# Altium schematic sheet Power.SchDoc
size A2
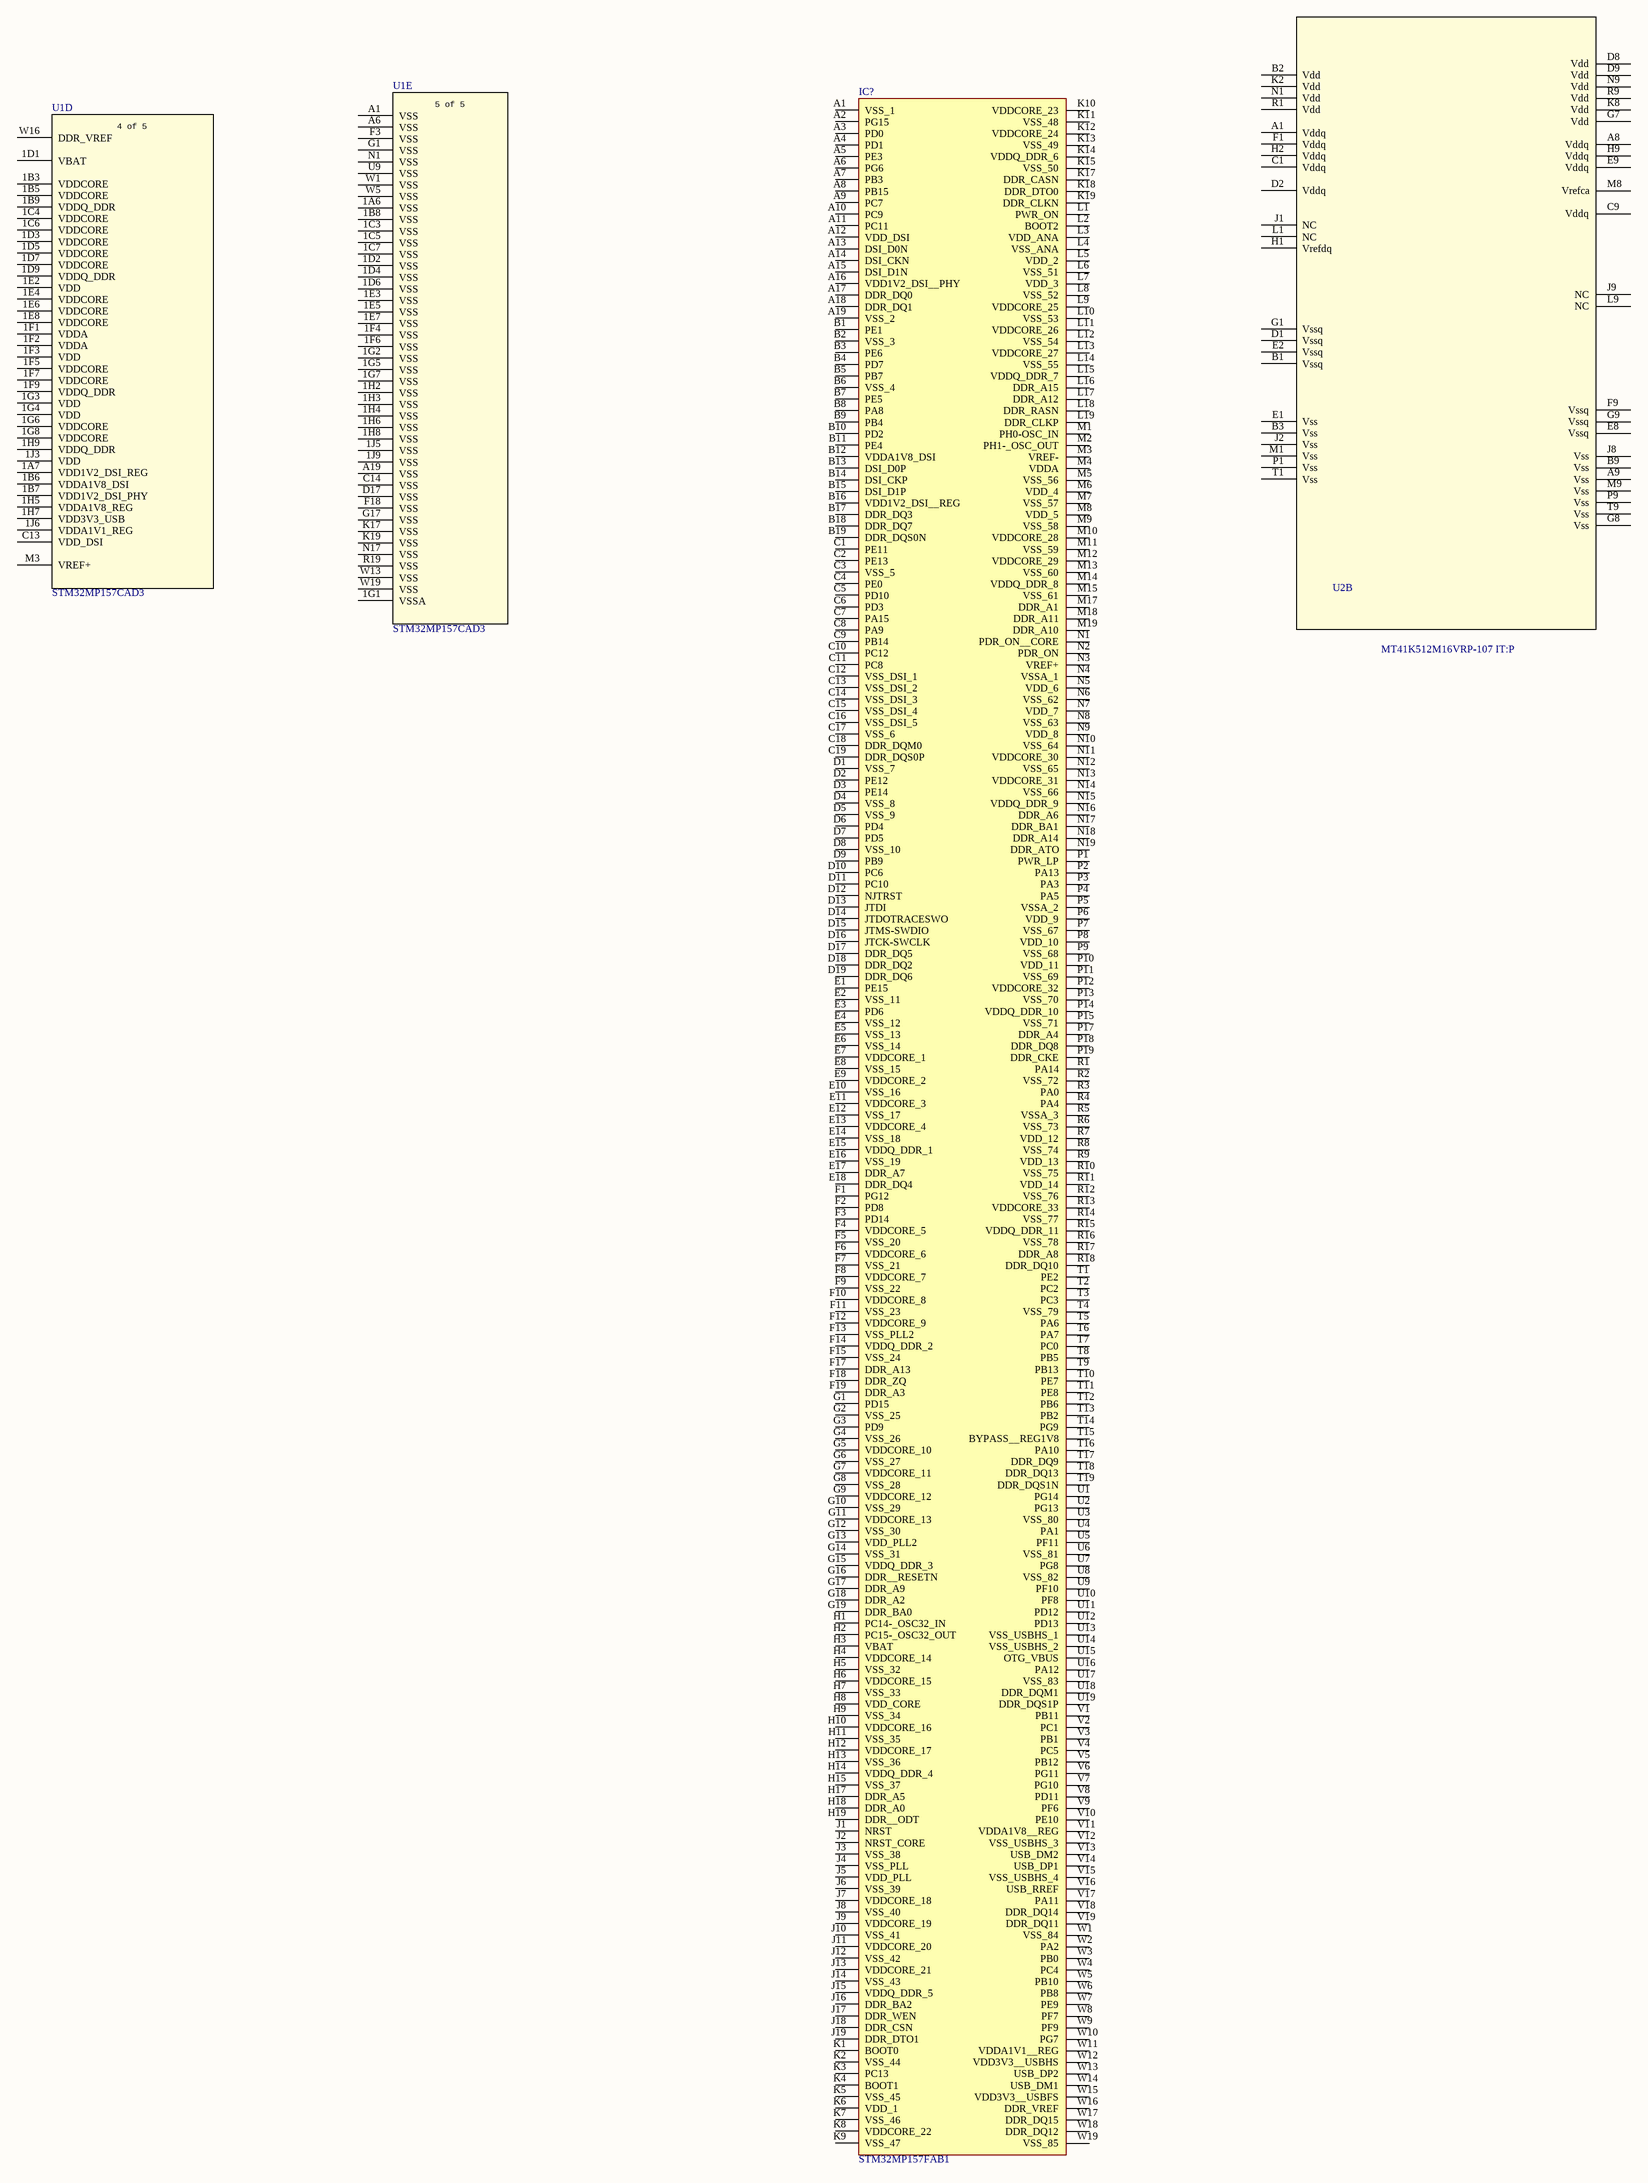
[diagram p0: Power.SchDoc]

## Parts
IC?  STM32MP157FAB1  [BGA354C80P19X19_1600X1600X129]
U1  STM32MP157CAD3  [TFBGA257_10X10]  (parts D,E of 5)
U2  MT41K512M16VRP-107 IT:P  [FBGA96_MRN]  (part B of 2)

## Nets

Not connected (* = marked no-connect by the designer): IC? A1(VSS_1) A2(PG15) A3(PD0) A4(PD1) A5(PE3) A6(PG6) A7(PB3) A8(PB15) A9(PC7) A10(PC9) A11(PC11) A12(VDD_DSI) A13(DSI_D0N) A14(DSI_CKN) A15(DSI_D1N) A16(VDD1V2_DSI__PHY) A17(DDR_DQ0) A18(DDR_DQ1) A19(VSS_2) B1(PE1) B2(VSS_3) B3(PE6) B4(PD7) B5(PB7) B6(VSS_4) B7(PE5) B8(PA8) B9(PB4) B10(PD2) B11(PE4) B12(VDDA1V8_DSI) B13(DSI_D0P) B14(DSI_CKP) B15(DSI_D1P) B16(VDD1V2_DSI__REG) B17(DDR_DQ3) B18(DDR_DQ7) B19(DDR_DQS0N) C1(PE11) C2(PE13) C3(VSS_5) C4(PE0) C5(PD10) C6(PD3) C7(PA15) C8(PA9) C9(PB14) C10(PC12) C11(PC8) C12(VSS_DSI_1) C13(VSS_DSI_2) C14(VSS_DSI_3) C15(VSS_DSI_4) C16(VSS_DSI_5) C17(VSS_6) C18(DDR_DQM0) C19(DDR_DQS0P) D1(VSS_7) D2(PE12) D3(PE14) D4(VSS_8) D5(VSS_9) D6(PD4) D7(PD5) D8(VSS_10) D9(PB9) D10(PC6) D11(PC10) D12(NJTRST) D13(JTDI) D14(JTDOTRACESWO) D15(JTMS-SWDIO) D16(JTCK-SWCLK) D17(DDR_DQ5) D18(DDR_DQ2) D19(DDR_DQ6) E1(PE15) E2(VSS_11) E3(PD6) E4(VSS_12) E5(VSS_13) E6(VSS_14) E7(VDDCORE_1) E8(VSS_15) E9(VDDCORE_2) E10(VSS_16) E11(VDDCORE_3) E12(VSS_17) E13(VDDCORE_4) E14(VSS_18) E15(VDDQ_DDR_1) E16(VSS_19) E17(DDR_A7) E18(DDR_DQ4) F1(PG12) F2(PD8) F3(PD14) F4(VDDCORE_5) F5(VSS_20) F6(VDDCORE_6) F7(VSS_21) F8(VDDCORE_7) F9(VSS_22) F10(VDDCORE_8) F11(VSS_23) F12(VDDCORE_9) F13(VSS_PLL2) F14(VDDQ_DDR_2) F15(VSS_24) F17(DDR_A13) F18(DDR_ZQ) F19(DDR_A3) G1(PD15) G2(VSS_25) G3(PD9) G4(VSS_26) G5(VDDCORE_10) G6(VSS_27) G7(VDDCORE_11) G8(VSS_28) G9(VDDCORE_12) G10(VSS_29) G11(VDDCORE_13) G12(VSS_30) G13(VDD_PLL2) G14(VSS_31) G15(VDDQ_DDR_3) G16(DDR__RESETN) G17(DDR_A9) G18(DDR_A2) G19(DDR_BA0) H1(PC14-_OSC32_IN) H2(PC15-_OSC32_OUT) H3(VBAT) H4(VDDCORE_14) H5(VSS_32) H6(VDDCORE_15) H7(VSS_33) H8(VDD_CORE) H9(VSS_34) H10(VDDCORE_16) H11(VSS_35) H12(VDDCORE_17) H13(VSS_36) H14(VDDQ_DDR_4) H15(VSS_37) H17(DDR_A5) H18(DDR_A0) H19(DDR__ODT) J1(NRST) J2(NRST_CORE) J3(VSS_38) J4(VSS_PLL) J5(VDD_PLL) J6(VSS_39) J7(VDDCORE_18) J8(VSS_40) J9(VDDCORE_19) J10(VSS_41) J11(VDDCORE_20) J12(VSS_42) J13(VDDCORE_21) J14(VSS_43) J15(VDDQ_DDR_5) J16(DDR_BA2) J17(DDR_WEN) J18(DDR_CSN) J19(DDR_DTO1) K1(BOOT0) K2(VSS_44) K3(PC13) K4(BOOT1) K5(VSS_45) K6(VDD_1) K7(VSS_46) K8(VDDCORE_22) K9(VSS_47) K10(VDDCORE_23) K11(VSS_48) K12(VDDCORE_24) K13(VSS_49) K14(VDDQ_DDR_6) K15(VSS_50) K17(DDR_CASN) K18(DDR_DTO0) K19(DDR_CLKN) L1(PWR_ON) L2(BOOT2) L3(VDD_ANA) L4(VSS_ANA) L5(VDD_2) L6(VSS_51) L7(VDD_3) L8(VSS_52) L9(VDDCORE_25) L10(VSS_53) L11(VDDCORE_26) L12(VSS_54) L13(VDDCORE_27) L14(VSS_55) L15(VDDQ_DDR_7) L16(DDR_A15) L17(DDR_A12) L18(DDR_RASN) L19(DDR_CLKP) M1(PH0-OSC_IN) M2(PH1-_OSC_OUT) M3(VREF-) M4(VDDA) M5(VSS_56) M6(VDD_4) M7(VSS_57) M8(VDD_5) M9(VSS_58) M10(VDDCORE_28) M11(VSS_59) M12(VDDCORE_29) M13(VSS_60) M14(VDDQ_DDR_8) M15(VSS_61) M17(DDR_A1) M18(DDR_A11) M19(DDR_A10) N1(PDR_ON__CORE) N2(PDR_ON) N3(VREF+) N4(VSSA_1) N5(VDD_6) N6(VSS_62) N7(VDD_7) N8(VSS_63) N9(VDD_8) N10(VSS_64) N11(VDDCORE_30) N12(VSS_65) N13(VDDCORE_31) N14(VSS_66) N15(VDDQ_DDR_9) N16(DDR_A6) N17(DDR_BA1) N18(DDR_A14) N19(DDR_ATO) P1(PWR_LP) P2(PA13) P3(PA3) P4(PA5) P5(VSSA_2) P6(VDD_9) P7(VSS_67) P8(VDD_10) P9(VSS_68) P10(VDD_11) P11(VSS_69) P12(VDDCORE_32) P13(VSS_70) P14(VDDQ_DDR_10) P15(VSS_71) P17(DDR_A4) P18(DDR_DQ8) P19(DDR_CKE) R1(PA14) R2(VSS_72) R3(PA0) R4(PA4) R5(VSSA_3) R6(VSS_73) R7(VDD_12) R8(VSS_74) R9(VDD_13) R10(VSS_75) R11(VDD_14) R12(VSS_76) R13(VDDCORE_33) R14(VSS_77) R15(VDDQ_DDR_11) R16(VSS_78) R17(DDR_A8) R18(DDR_DQ10) T1(PE2) T2(PC2) T3(PC3) T4(VSS_79) T5(PA6) T6(PA7) T7(PC0) T8(PB5) T9(PB13) T10(PE7) T11(PE8) T12(PB6) T13(PB2) T14(PG9) T15(BYPASS__REG1V8) T16(PA10) T17(DDR_DQ9) T18(DDR_DQ13) T19(DDR_DQS1N) U1(PG14) U2(PG13) U3(VSS_80) U4(PA1) U5(PF11) U6(VSS_81) U7(PG8) U8(VSS_82) U9(PF10) U10(PF8) U11(PD12) U12(PD13) U13(VSS_USBHS_1) U14(VSS_USBHS_2) U15(OTG_VBUS) U16(PA12) U17(VSS_83) U18(DDR_DQM1) U19(DDR_DQS1P) V1(PB11) V2(PC1) V3(PB1) V4(PC5) V5(PB12) V6(PG11) V7(PG10) V8(PD11) V9(PF6) V10(PE10) V11(VDDA1V8__REG) V12(VSS_USBHS_3) V13(USB_DM2) V14(USB_DP1) V15(VSS_USBHS_4) V16(USB_RREF) V17(PA11) V18(DDR_DQ14) V19(DDR_DQ11) W1(VSS_84) W2(PA2) W3(PB0) W4(PC4) W5(PB10) W6(PB8) W7(PE9) W8(PF7) W9(PF9) W10(PG7) W11(VDDA1V1__REG) W12(VDD3V3__USBHS) W13(USB_DP2) W14(USB_DM1) W15(VDD3V3__USBFS) W16(DDR_VREF) W17(DDR_DQ15) W18(DDR_DQ12) W19(VSS_85); U1 1A6(VSS) 1A7(VDD1V2_DSI_REG) 1B3(VDDCORE) 1B5(VDDCORE) 1B6(VDDA1V8_DSI) 1B7(VDD1V2_DSI_PHY) 1B8(VSS) 1B9(VDDQ_DDR) 1C3(VSS) 1C4(VDDCORE) 1C5(VSS) 1C6(VDDCORE) 1C7(VSS) 1D1(VBAT) 1D2(VSS) 1D3(VDDCORE) 1D4(VSS) 1D5(VDDCORE) 1D6(VSS) 1D7(VDDCORE) 1D9(VDDQ_DDR) 1E2(VDD) 1E3(VSS) 1E4(VDDCORE) 1E5(VSS) 1E6(VDDCORE) 1E7(VSS) 1E8(VDDCORE) 1F1(VDDA) 1F2(VDDA) 1F3(VDD) 1F4(VSS) 1F5(VDDCORE) 1F6(VSS) 1F7(VDDCORE) 1F9(VDDQ_DDR) 1G1(VSSA) 1G2(VSS) 1G3(VDD) 1G4(VDD) 1G5(VSS) 1G6(VDDCORE) 1G7(VSS) 1G8(VDDCORE) 1H2(VSS) 1H3(VSS) 1H4(VSS) 1H5(VDDA1V8_REG) 1H6(VSS) 1H7(VDD3V3_USB) 1H8(VSS) 1H9(VDDQ_DDR) 1J3(VDD) 1J5(VSS) 1J6(VDDA1V1_REG) 1J9(VSS) A1(VSS) A6(VSS) A19(VSS) C13(VDD_DSI) C14(VSS) D17(VSS) F3(VSS) F18(VSS) G1(VSS) G17(VSS) K17(VSS) K19(VSS) M3(VREF+) N1(VSS) N17(VSS) R19(VSS) U9(VSS) W1(VSS) W5(VSS) W13(VSS) W16(DDR_VREF) W19(VSS); U2 A1(Vddq) A8(Vddq) A9(Vss) B1(Vssq) B2(Vdd) B3(Vss) B9(Vss) C1(Vddq) C9(Vddq) D1(Vssq) D2(Vddq) D8(Vdd) D9(Vdd) E1(Vss) E2(Vssq) E8(Vssq) E9(Vddq) F1(Vddq) F9(Vssq) G1(Vssq) G7(Vdd) G8(Vss) G9(Vssq) H1(Vrefdq) H2(Vddq) H9(Vddq) J1(NC) J2(Vss) J8(Vss) J9(NC) K2(Vdd) K8(Vdd) L1(NC) L9(NC) M1(Vss) M8(Vrefca) M9(Vss) N1(Vdd) N9(Vdd) P1(Vss) P9(Vss) R1(Vdd) R9(Vdd) T1(Vss) T9(Vss)

## Notes on the sheet
- (in symbol STM32MP157CAD3, part D) 4 of 5
- (in symbol STM32MP157CAD3, part E) 5 of 5

## Library data of the parts
IC? = STM32MP157FAB1: Integrated Circuit; Manufacturer_Name: STMicroelectronics; Datasheet Link: https://www.st.com/resource/en/datasheet/stm32mp157f.pdf; Height: 1.29mm; Manufacturer_Part_Number: STM32MP157FAB1; Mouser Part Number: 511-STM32MP157FAB1; Mouser Price/Stock: https://www.mouser.co.uk/ProductDetail/STMicroelectronics/STM32MP157FAB1?qs=xZ%2FP%252Ba9zWqaMNhk4KMq8KA%3D%3D; Arrow Part Number: STM32MP157FAB1; Arrow Price/Stock: https://www.arrow.com/en/products/stm32mp157fab1/stmicroelectronics?region=nac
U1 = STM32MP157CAD3: No Description Available; Mfr_Name: STMicroelectronics; Copyright: Copyright (C) 2022 Ultra Librarian. All rights reserved.; Manufacturer_Part_Number: STM32MP157CAD3; RefDes: RefDes; Type: DEV
U2 = MT41K512M16VRP-107 IT:P: No Description Available; Mfr_Name: Micron; Copyright: Copyright (C) 2022 Ultra Librarian. All rights reserved.; Manufacturer_Part_Number: MT41K512M16VRP-107 IT:P; RefDes: RefDes; Type: DEV